# Altium schematic sheet Control_Stage.SchDoc
size 304 x 152 mm; SheetNumber: 3; SheetTotal: 3
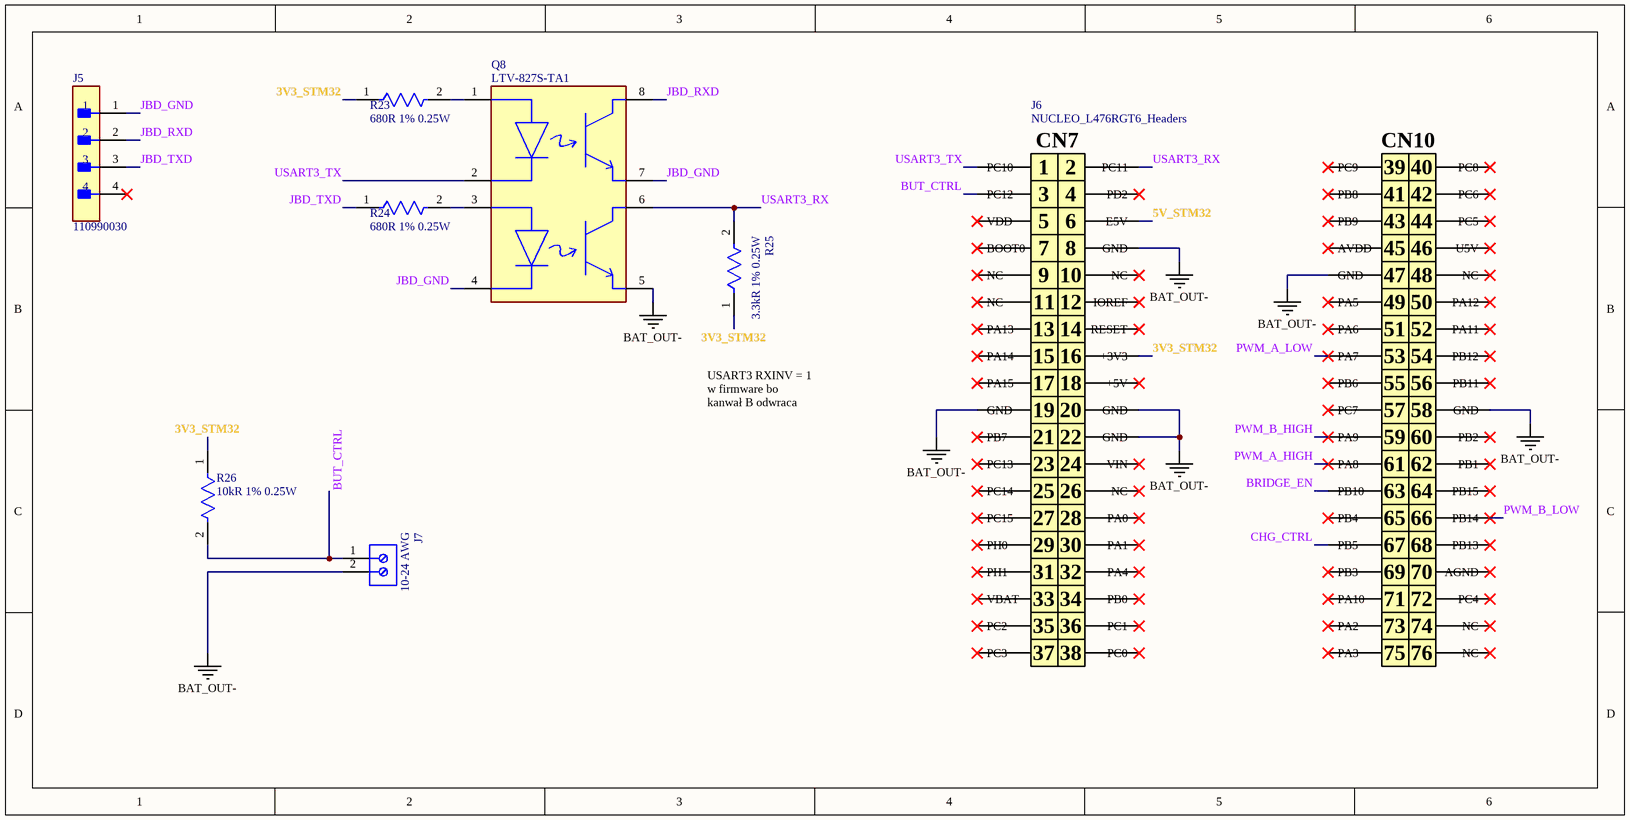
[diagram p0: Control_Stage.SchDoc]

## Parts
J5  110990030  [FP-110990030-MFG]
J6  NUCLEO_L476RGT6_Headers  [NUCLEO_L4764RGT6_Header]
J7  10-24 AWG  [PHOE-1714955_V]
Q8  LTV-827S-TA1  [FP-LTV-827S-TA1-MFG]
R23  680R 1% 0.25W  [FP-RT1206-MFG]
R24  680R 1% 0.25W  [FP-RT1206-MFG]
R25  3.3kR 1% 0.25W  [FP-RT1206-MFG]
R26  10kR 1% 0.25W  [FP-RT1206-MFG]

## Nets
BAT_OUT-: J6.8(GND) J6.19(GND) J6.20(GND) J6.22(GND) J6.47(GND) J6.58(GND) J7.2 Q8.5(E)
3V3_STM32: J6.16(+3V3) R23.1 R25.1 R26.1
5V_STM32: J6.6(E5V)
BRIDGE_EN: J6.63(PB10)
BUT_CTRL: J6.3(PC12) J7.1 R26.2
CHG_CTRL: J6.67(PB5)
JBD_GND: J5.1 Q8.4(2_Cathode) Q8.7(E)
JBD_RXD: J5.2 Q8.8(C)
JBD_TXD: J5.3 R24.1
PWM_A_HIGH: J6.61(PA8)
PWM_A_LOW: J6.53(PA7)
PWM_B_HIGH: J6.59(PA9)
PWM_B_LOW: J6.66(PB14)
USART3_RX: J6.2(PC11) Q8.6(C) R25.2
USART3_TX: J6.1(PC10) Q8.2(1_Cathode)
NetQ8_1: Q8.1(1_Anode) R23.2
NetQ8_3: Q8.3(2_Anode) R24.2

Not connected (* = marked no-connect by the designer): J5 4*; J6 4(PD2)* 5(VDD)* 7(BOOT0)* 9(NC)* 10(NC)* 11(NC)* 12(IOREF)* 13(PA13)* 14(RESET)* 15(PA14)* 17(PA15)* 18(+5V)* 21(PB7)* 23(PC13)* 24(VIN)* 25(PC14)* 26(NC)* 27(PC15)* 28(PA0)* 29(PH0)* 30(PA1)* 31(PH1)* 32(PA4)* 33(VBAT)* 34(PB0)* 35(PC2)* 36(PC1)* 37(PC3)* 38(PC0)* 39(PC9)* 40(PC8)* 41(PB8)* 42(PC6)* 43(PB9)* 44(PC5)* 45(AVDD)* 46(U5V)* 48(NC)* 49(PA5)* 50(PA12)* 51(PA6)* 52(PA11)* 54(PB12)* 55(PB6)* 56(PB11)* 57(PC7)* 60(PB2)* 62(PB1)* 64(PB15)* 65(PB4)* 68(PB13)* 69(PB3)* 70(AGND)* 71(PA10)* 72(PC4)* 73(PA2)* 74(NC)* 75(PA3)* 76(NC)*

## Notes on the sheet
- USART3 RXINV = 1 w firmware bo kanwał B odwraca sygnał
- (in symbol NUCLEO_L476RGT6_Headers) CN7; CN10

## Library data of the parts
J5 = CMP-139044-000001-1: GROVE 2MM 4PIN VERT CONN 10PCS; Series: -
J6 = NUCLEO_L476RGT6_Headers: Headers for NUCLEO L476RG T6 Board.; Manufacturer:: Amphenol FCI; Manufacturer Part Number:: 76342-319LF; Supplier 1:: Mouser; Supplier Part Number 1:: 649-76342-319LF; ComponentLink1Description: Mouser Link; ComponentLink1URL: https://www.mouser.pl/ProductDetail/Amphenol-FCI/76342-319LF?qs=5xI8GKdkXlkDdCCMwMnBAg%3D%3D
J7 = CMP-2000-05797-1: 1714955 / PC Terminal Block, Pitch 6.35 mm, 1 x 2 Position, Height 21.5 mm, Tail Lenght 5.1 mm, RoHS, Bulk; Manufacturer: Phoenix Contact; Package Description: PC Terminal Block, Pitch 6.35 mm, 1 x 2 Position, Height 21.5 mm, Tail Lenght 5.1 mm; Datasheet URL: http://media.digikey.com/pdf/Data%20Sheets/Phoenix%20Contact%20PDFs/1714955.pdf; Package Reference: 1714955; Manufacturer URL: http://www.phoenixcontact.com/; Datasheet Version: 02/2010; Mounting Technology: ThroughHole
Q8 = CMP-22018-000005-1: OPTOISOLATOR 5KV 2CH TRANS 8-SMD; Number of Channels: 2; Forward Current: 50mA; Reverse Breakdown Voltage: 6V; Current Transfer Ratio: 600%; Collector Emitter Saturation Voltage: 200mV; Collector Emitter Voltage (VCEO): 35V; Max Power Dissipation: 200mW; Rise Time: 18000ns; Forward Voltage: 1.4V; Number of Elements: 2; Min Operating Temperature: -30°C; Number of Circuits: 2; Max Collector Current: 50mA; Packaging: Tape and Reel; Max Input Current: 50mA; Case/Package: SMD/SMT; Radiation Hardening: No; Package Quantity: 1000; Max Output Voltage: 35V; Output Current per Channel: 50mA; Fall Time: 18000ns; Mount: Surface Mount; Isolation Voltage: 5kV; Power Dissipation: 200mW; Lead Free: Lead Free; Max Operating Temperature: 110°C; Output Voltage: 35V; Number of Pins: 8
R23 R24 = CMP-2003-04104-2: RT1206FRE07680RL / RES SMD 680 OHM 1% 1/4W 1206; Manufacturer: Yageo; Description: RT1206 680Ω 0.25W 50 ppm/°C 0.02%; Resistance: 680Ω; Value: 680Ω; Temperature Coefficient: 50 ppm/°C; Tolerance: 0.0002; Voltage Rating: 200V; Device Class L3: Chip SMD Resistors; RoHS: TRUE; Digikey Description: RES SMD 680 OHM 1% 1/4W 1206; Lead Free: Yes; Mouser Description: Res Thin Film 1206 680 Ohm 1% 1/4W ±50ppm/°C Molded SMD SMD Paper T/R; Temperature Range Low: -55°C; Category: Res; ComponentLink2URL: http://www.yageo.com/documents/recent/PYu-RT_1-to-0.01_RoHS_L_9.pdf; Ipc Land Pattern Name: RESC310160X55; Octopart: https://octopart.com/rt1206fre07680rl-yageo-1466321; Series: RT; Device Class L2: Resistors; Device Class L1: Passive Components; ComponentLink2Description: Datasheet; Temperature: -55°C to +155°C; Automotive: No; Composition: Thin Film; Manufacturer Part Number: RT1206FRE07680RL; Power Rating: 0.25W; Footprint Url: http://www.yageo.com/exep/pages/download/literatures/PYu-R_Mount_10.pdf; Temperature Range High: +155°C; Package: RT1206; Height: 0.65mm
R25 = CMP-2003-04314-2: RT1206FRE073K3L / RES SMD 3.3K OHM 1% 1/4W 1206; Manufacturer: Yageo; Temperature Coefficient: 50 ppm/°C; Description: RT1206 3.3KΩ 0.25W 50 ppm/°C 0.02%; Resistance: 3.3KΩ; Value: 3.3KΩ; Voltage Rating: 200V; Tolerance: 0.0002; Manufacturer Part Number: RT1206FRE073K3L; Height: 0.65mm; ComponentLink2Description: Datasheet; Lead Free: Yes; Temperature: -55°C to +155°C; Digikey Description: RES SMD 3.3K OHM 1% 1/4W 1206; Temperature Range High: +155°C; Category: Res; Footprint Url: http://www.yageo.com/exep/pages/download/literatures/PYu-R_Mount_10.pdf; Device Class L2: Resistors; Package: RT1206; Device Class L1: Passive Components; RoHS: TRUE; ComponentLink2URL: http://www.yageo.com/documents/recent/PYu-RT_1-to-0.01_RoHS_L_9.pdf; Device Class L3: Chip SMD Resistors; Temperature Range Low: -55°C; Octopart: https://octopart.com/rt1206fre073k3l-yageo-1236583; Automotive: No; Composition: Thin Film; Mouser Description: Thin Film Resistors - SMD 1/4W 3.3K ohm 1% 50ppm; Ipc Land Pattern Name: RESC310160X55; Series: RT; Power Rating: 0.25W
R26 = CMP-2003-04299-2: RT1206FRE0710KL / RES 10.0K OHM 1/4W 1% SMD 1206; Manufacturer: Yageo; Voltage Rating: 200V; Temperature Coefficient: 50 ppm/°C; Tolerance: 0.0002; Value: 10KΩ; Height: 0.65mm; Composition: Thin Film; Temperature Range Low: -55°C; Temperature Range High: +155°C; Device Class L2: Resistors; Power Rating: 0.25W; RoHS: TRUE; Digikey Description: RES 10.0K OHM 1/4W 1% SMD 1206; Manufacturer Part Number: RT1206FRE0710KL; Device Class L1: Passive Components; ComponentLink2URL: http://www.yageo.com/documents/recent/PYu-RT_1-to-0.01_RoHS_L_9.pdf; Category: Res; Lead Free: Yes; Mouser Description: Thin Film Resistors 1/4W 10K ohm 1% 50ppm; Octopart: https://octopart.com/rt1206fre0710kl-yageo-1169575; ComponentLink2Description: Datasheet; Footprint Url: http://www.yageo.com/exep/pages/download/literatures/PYu-R_Mount_10.pdf; Ipc Land Pattern Name: RESC310160X55; Package: RT1206; Automotive: No; Device Class L3: Chip SMD Resistors; Temperature: -55°C to +155°C; Series: RT; Resistance: 10KΩ